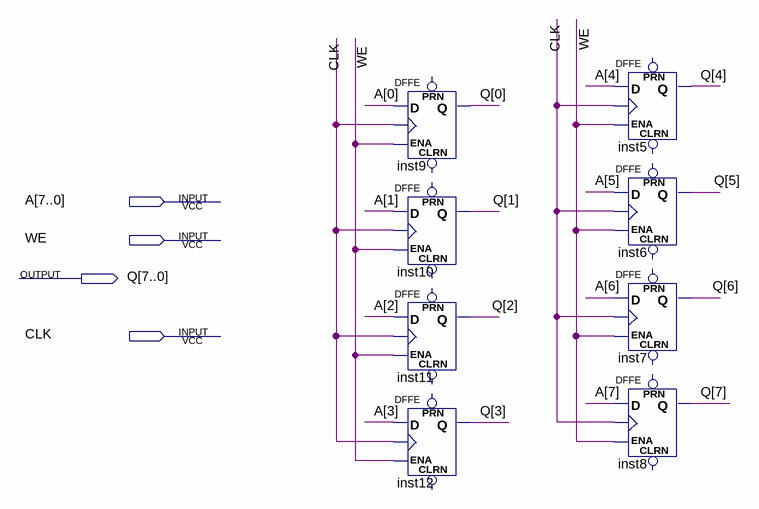
[diagram p0: schematic sheet]
// Quartus schematic 8bit-Register.bdf as structural Verilog: 8 symbols, 4 pins
module \8bit-Register  (
  input  [7:0] A,
  input  WE,
  input  CLK,
  output [7:0] Q
);

  DFFE inst9 (.D(A[0]), .CLK(CLK), .ENA(WE), .Q(Q[0]));  // open: PRN, CLRN
  DFFE inst10 (.D(A[1]), .CLK(CLK), .ENA(WE), .Q(Q[1]));  // open: PRN, CLRN
  DFFE inst11 (.D(A[2]), .CLK(CLK), .ENA(WE), .Q(Q[2]));  // open: PRN, CLRN
  DFFE inst12 (.D(A[3]), .CLK(CLK), .ENA(WE), .Q(Q[3]));  // open: PRN, CLRN
  DFFE inst5 (.D(A[4]), .CLK(CLK), .ENA(WE), .Q(Q[4]));  // open: PRN, CLRN
  DFFE inst6 (.D(A[5]), .CLK(CLK), .ENA(WE), .Q(Q[5]));  // open: PRN, CLRN
  DFFE inst7 (.D(A[6]), .CLK(CLK), .ENA(WE), .Q(Q[6]));  // open: PRN, CLRN
  DFFE inst8 (.D(A[7]), .CLK(CLK), .ENA(WE), .Q(Q[7]));  // open: PRN, CLRN
endmodule
